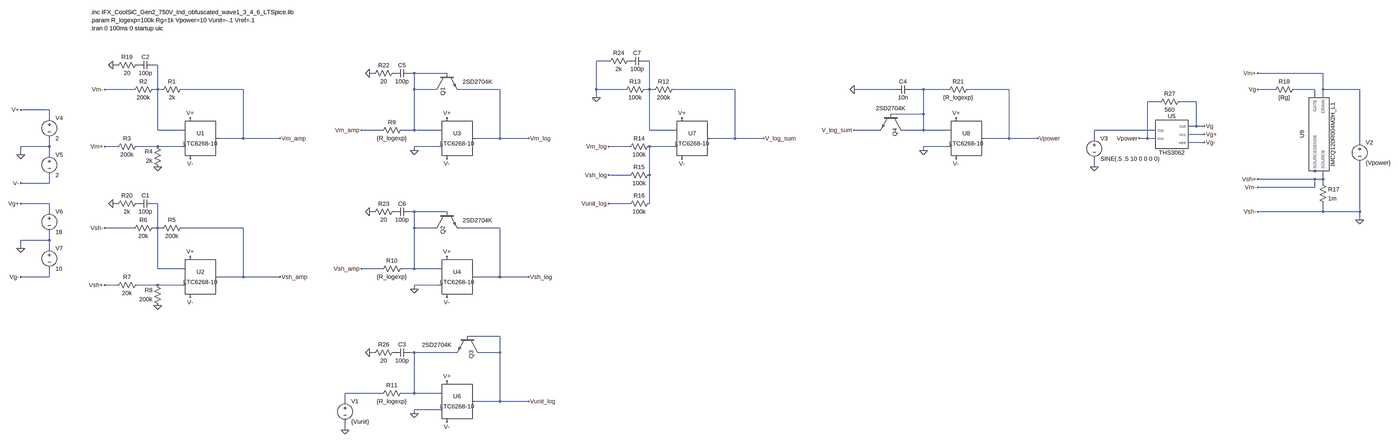
[diagram p0: schematic Power Tester.asc, whole sheet]
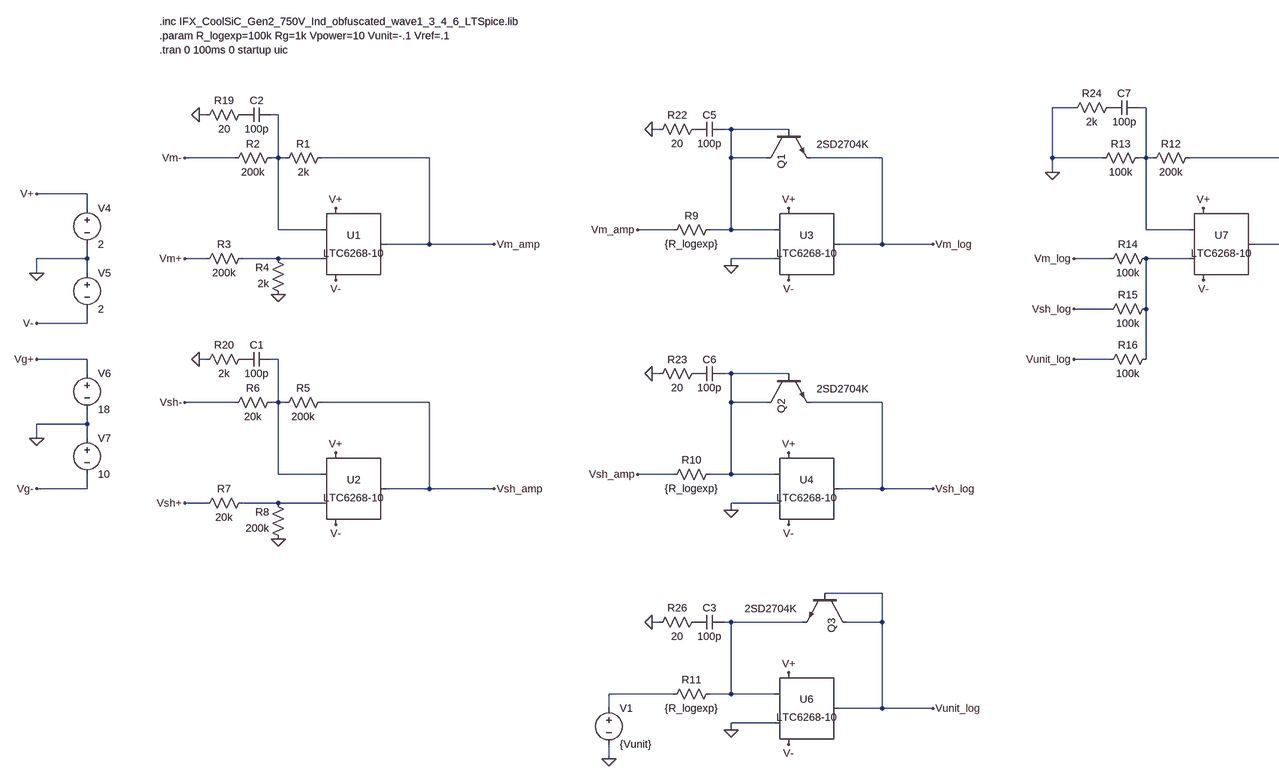
[diagram p1: schematic Power Tester.asc, part, row 1 of 1, column 1 of 2]
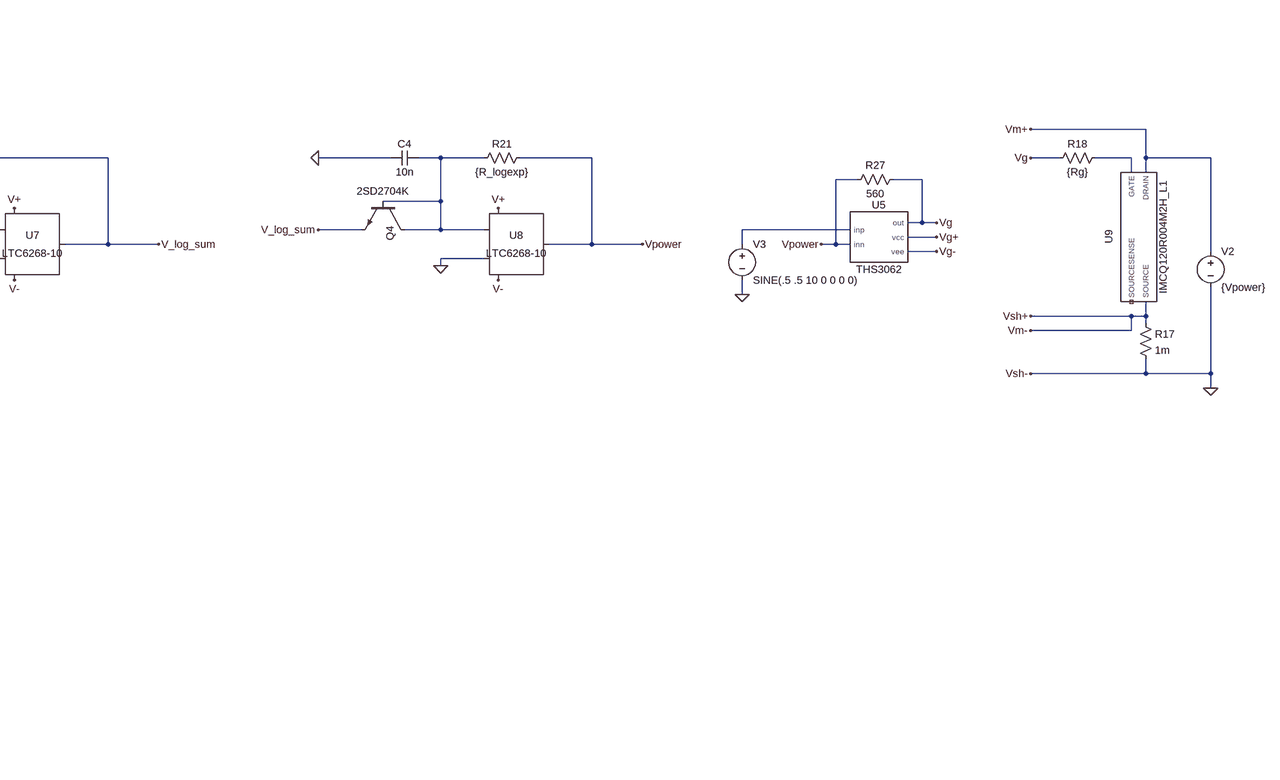
[diagram p2: schematic Power Tester.asc, part, row 1 of 1, column 2 of 2]
Power Tester.asc, the LTspice schematic file:
Version 4.1
SHEET 1 6168 1376
WIRE 2432 -192 2384 -192
WIRE 2592 -192 2576 -192
WIRE -192 -176 -208 -176
WIRE -32 -176 -48 -176
WIRE 1120 -144 1104 -144
WIRE 1280 -144 1264 -144
WIRE 1408 -144 1280 -144
WIRE 5808 -144 5552 -144
WIRE -128 -80 -240 -80
WIRE -32 -80 -32 -176
WIRE -32 -80 -48 -80
WIRE -16 -80 -32 -80
WIRE 304 -80 64 -80
WIRE 1280 -80 1280 -144
WIRE 1360 -80 1280 -80
WIRE 1616 -80 1456 -80
WIRE 2384 -80 2384 -192
WIRE 2496 -80 2384 -80
WIRE 2592 -80 2592 -192
WIRE 2592 -80 2576 -80
WIRE 2608 -80 2592 -80
WIRE 2928 -80 2688 -80
WIRE 3792 -80 3632 -80
WIRE 3904 -80 3856 -80
WIRE 4000 -80 3904 -80
WIRE 4240 -80 4080 -80
WIRE 5616 -80 5552 -80
WIRE 5776 -80 5696 -80
WIRE 5808 -80 5808 -144
WIRE 5952 -80 5808 -80
WIRE 2384 -48 2384 -80
WIRE 5776 -48 5776 -80
WIRE 5808 -48 5808 -80
WIRE 4960 -32 4912 -32
WIRE 5104 -32 5040 -32
WIRE -912 0 -1024 0
WIRE 3904 16 3904 -80
WIRE 3904 16 3776 16
WIRE -912 32 -912 0
WIRE 5104 64 5104 -32
WIRE 5104 64 5072 64
WIRE 5136 64 5104 64
WIRE -32 80 -32 -80
WIRE 64 80 -32 80
WIRE 1152 80 1072 80
WIRE 1280 80 1280 -80
WIRE 1280 80 1232 80
WIRE 1376 80 1280 80
WIRE 2592 80 2592 -80
WIRE 2688 80 2592 80
WIRE 3728 80 3632 80
WIRE 3904 80 3904 16
WIRE 3904 80 3824 80
WIRE 4000 80 3904 80
WIRE 4944 80 4704 80
WIRE 5136 96 5072 96
WIRE 304 112 304 -80
WIRE 304 112 208 112
WIRE 448 112 304 112
WIRE 1616 112 1616 -80
WIRE 1616 112 1520 112
WIRE 1760 112 1616 112
WIRE 2928 112 2928 -80
WIRE 2928 112 2832 112
WIRE 3072 112 2928 112
WIRE 4240 112 4240 -80
WIRE 4240 112 4144 112
WIRE 4384 112 4240 112
WIRE 4704 112 4704 80
WIRE 4912 112 4912 -32
WIRE 4912 112 4880 112
WIRE 4944 112 4912 112
WIRE 5136 128 5072 128
WIRE 5952 128 5952 -80
WIRE -912 144 -912 112
WIRE -912 144 -1024 144
WIRE -192 144 -240 144
WIRE -32 144 -112 144
WIRE 64 144 -32 144
WIRE 1376 144 1280 144
WIRE 2512 144 2432 144
WIRE 2688 144 2592 144
WIRE 4000 144 3904 144
WIRE 1280 160 1280 144
WIRE 3904 160 3904 144
WIRE -1024 176 -1024 144
WIRE -912 176 -912 144
WIRE 4704 224 4704 192
WIRE 2512 256 2432 256
WIRE 2592 256 2592 144
WIRE 5776 272 5552 272
WIRE 5808 272 5808 240
WIRE 5808 272 5776 272
WIRE -912 288 -912 256
WIRE -912 288 -1024 288
WIRE 5808 288 5808 272
WIRE 5776 304 5776 272
WIRE 5776 304 5552 304
WIRE -912 368 -1024 368
WIRE -192 368 -208 368
WIRE -32 368 -48 368
WIRE 2512 368 2432 368
WIRE 2592 368 2592 256
WIRE -912 400 -912 368
WIRE 1120 400 1104 400
WIRE 1280 400 1264 400
WIRE 1408 400 1280 400
WIRE 5808 400 5808 368
WIRE 5808 400 5552 400
WIRE 5952 400 5952 208
WIRE 5952 400 5808 400
WIRE 5952 432 5952 400
WIRE -128 464 -240 464
WIRE -32 464 -32 368
WIRE -32 464 -48 464
WIRE -16 464 -32 464
WIRE 304 464 64 464
WIRE 1280 464 1280 400
WIRE 1360 464 1280 464
WIRE 1616 464 1456 464
WIRE -912 512 -912 480
WIRE -912 512 -1024 512
WIRE -1024 544 -1024 512
WIRE -912 544 -912 512
WIRE -32 624 -32 464
WIRE 64 624 -32 624
WIRE 1152 624 1072 624
WIRE 1280 624 1280 464
WIRE 1280 624 1232 624
WIRE 1376 624 1280 624
WIRE -912 656 -912 624
WIRE -912 656 -1024 656
WIRE 304 656 304 464
WIRE 304 656 208 656
WIRE 448 656 304 656
WIRE 1616 656 1616 464
WIRE 1616 656 1520 656
WIRE 1760 656 1616 656
WIRE -192 688 -240 688
WIRE -32 688 -112 688
WIRE 64 688 -32 688
WIRE 1376 688 1280 688
WIRE 1280 704 1280 688
WIRE 1616 944 1488 944
WIRE 1120 1008 1104 1008
WIRE 1280 1008 1264 1008
WIRE 1440 1008 1280 1008
WIRE 1616 1008 1616 944
WIRE 1616 1008 1536 1008
WIRE 1152 1168 1008 1168
WIRE 1280 1168 1280 1008
WIRE 1280 1168 1232 1168
WIRE 1376 1168 1280 1168
WIRE 1008 1200 1008 1168
WIRE 1616 1200 1616 1008
WIRE 1616 1200 1520 1200
WIRE 1760 1200 1616 1200
WIRE 1376 1232 1280 1232
WIRE 1280 1248 1280 1232
WIRE 1008 1312 1008 1280
FLAG -32 224 0
FLAG 96 192 V-
FLAG 96 32 V+
FLAG -240 -80 Vm-
FLAG -240 144 Vm+
FLAG -32 768 0
FLAG 96 736 V-
FLAG 96 576 V+
FLAG -240 464 Vsh-
FLAG -240 688 Vsh+
FLAG 1408 192 V-
FLAG 1408 32 V+
FLAG 448 112 Vm_amp
FLAG 448 656 Vsh_amp
FLAG 1280 160 0
FLAG 1072 80 Vm_amp
FLAG 1760 112 Vm_log
FLAG 1408 736 V-
FLAG 1408 576 V+
FLAG 1280 704 0
FLAG 1072 624 Vsh_amp
FLAG 1760 656 Vsh_log
FLAG 1408 1280 V-
FLAG 1408 1120 V+
FLAG 1280 1248 0
FLAG 1760 1200 Vunit_log
FLAG 1008 1312 0
FLAG 2720 192 V-
FLAG 3072 112 V_log_sum
FLAG 2720 32 V+
FLAG 2384 -48 0
FLAG 2432 256 Vsh_log
FLAG 2432 144 Vm_log
FLAG 2432 368 Vunit_log
FLAG 4032 192 V-
FLAG 4032 32 V+
FLAG 3904 160 0
FLAG 3632 80 V_log_sum
FLAG 4384 112 Vpower
FLAG 5136 96 Vg+
FLAG 5136 128 Vg-
FLAG 5136 64 Vg
FLAG 4880 112 Vpower
FLAG 5552 -80 Vg
FLAG 5552 272 Vsh+
FLAG 5552 304 Vm-
FLAG 5552 400 Vsh-
FLAG 5552 -144 Vm+
FLAG 4704 224 0
FLAG 5952 432 0
FLAG -1024 176 0
FLAG -1024 0 V+
FLAG -1024 288 V-
FLAG -1024 544 0
FLAG -1024 368 Vg+
FLAG -1024 656 Vg-
FLAG -208 -176 0
FLAG -208 368 0
FLAG 1104 -144 0
FLAG 1104 400 0
FLAG 3632 -80 0
FLAG 1104 1008 0
SYMBOL OpAmps\\LTC6268-10 96 112 R0
SYMATTR InstName U1
SYMBOL res 80 -96 R90
WINDOW 0 0 56 VBottom 2
WINDOW 3 32 56 VTop 2
SYMATTR InstName R1
SYMATTR Value 2k
SYMBOL res -32 -96 R90
WINDOW 0 0 56 VBottom 2
WINDOW 3 32 56 VTop 2
SYMATTR InstName R2
SYMATTR Value 200k
SYMBOL res -96 128 R90
WINDOW 0 0 56 VBottom 2
WINDOW 3 32 56 VTop 2
SYMATTR InstName R3
SYMATTR Value 200k
SYMBOL res -16 240 R180
WINDOW 0 36 76 Left 2
WINDOW 3 36 40 Left 2
SYMATTR InstName R4
SYMATTR Value 2k
SYMBOL OpAmps\\LTC6268-10 96 656 R0
SYMATTR InstName U2
SYMBOL res 80 448 R90
WINDOW 0 0 56 VBottom 2
WINDOW 3 32 56 VTop 2
SYMATTR InstName R5
SYMATTR Value 200k
SYMBOL res -32 448 R90
WINDOW 0 0 56 VBottom 2
WINDOW 3 32 56 VTop 2
SYMATTR InstName R6
SYMATTR Value 20k
SYMBOL res -96 672 R90
WINDOW 0 0 56 VBottom 2
WINDOW 3 32 56 VTop 2
SYMATTR InstName R7
SYMATTR Value 20k
SYMBOL res -16 784 R180
WINDOW 0 36 76 Left 2
WINDOW 3 36 40 Left 2
SYMATTR InstName R8
SYMATTR Value 200k
SYMBOL OpAmps\\LTC6268-10 1408 112 R0
SYMATTR InstName U3
SYMBOL OpAmps\\LTC6268-10 1408 656 R0
SYMATTR InstName U4
SYMBOL OpAmps\\LTC6268-10 1408 1200 R0
SYMATTR InstName U6
SYMBOL res 1248 64 R90
WINDOW 0 0 56 VBottom 2
WINDOW 3 32 56 VTop 2
SYMATTR InstName R9
SYMATTR Value {R_logexp}
SYMBOL npn 1360 -144 M90
WINDOW 3 34 226 VLeft 2
SYMATTR Value 2SD2704K
SYMATTR InstName Q1
SYMBOL res 1248 608 R90
WINDOW 0 0 56 VBottom 2
WINDOW 3 32 56 VTop 2
SYMATTR InstName R10
SYMATTR Value {R_logexp}
SYMBOL npn 1360 400 M90
WINDOW 3 34 226 VLeft 2
SYMATTR Value 2SD2704K
SYMATTR InstName Q2
SYMBOL res 1248 1152 R90
WINDOW 0 0 56 VBottom 2
WINDOW 3 32 56 VTop 2
SYMATTR InstName R11
SYMATTR Value {R_logexp}
SYMBOL npn 1536 944 R90
WINDOW 3 34 226 VLeft 2
SYMATTR Value 2SD2704K
SYMATTR InstName Q3
SYMBOL voltage 1008 1184 R0
WINDOW 123 0 0 Left 0
WINDOW 39 0 0 Left 0
SYMATTR InstName V1
SYMATTR Value {Vunit}
SYMBOL OpAmps\\LTC6268-10 2720 112 R0
SYMATTR InstName U7
SYMBOL res 2704 -96 R90
WINDOW 0 0 56 VBottom 2
WINDOW 3 32 56 VTop 2
SYMATTR InstName R12
SYMATTR Value 200k
SYMBOL res 2592 -96 R90
WINDOW 0 0 56 VBottom 2
WINDOW 3 32 56 VTop 2
SYMATTR InstName R13
SYMATTR Value 100k
SYMBOL res 2608 240 R90
WINDOW 0 0 56 VBottom 2
WINDOW 3 32 56 VTop 2
SYMATTR InstName R15
SYMATTR Value 100k
SYMBOL res 2608 128 R90
WINDOW 0 0 56 VBottom 2
WINDOW 3 32 56 VTop 2
SYMATTR InstName R14
SYMATTR Value 100k
SYMBOL res 2608 352 R90
WINDOW 0 0 56 VBottom 2
WINDOW 3 32 56 VTop 2
SYMATTR InstName R16
SYMATTR Value 100k
SYMBOL OpAmps\\LTC6268-10 4032 112 R0
SYMATTR InstName U8
SYMBOL res 4096 -96 R90
WINDOW 0 0 56 VBottom 2
WINDOW 3 32 56 VTop 2
SYMATTR InstName R21
SYMATTR Value {R_logexp}
SYMBOL npn 3824 16 R90
WINDOW 3 -22 107 VLeft 2
SYMATTR Value 2SD2704K
SYMATTR InstName Q4
SYMBOL THS3062 5008 96 R0
SYMATTR InstName U5
SYMBOL IMCQ120R004M2H_L1 5792 96 R90
WINDOW 0 0 50 Top 2
WINDOW 3 0 -71 Top 2
SYMATTR InstName U9
SYMBOL voltage 5952 112 R0
WINDOW 123 0 0 Left 0
WINDOW 39 0 0 Left 0
SYMATTR InstName V2
SYMATTR Value {Vpower}
SYMBOL res 5792 272 R0
SYMATTR InstName R17
SYMATTR Value 1m
SYMBOL res 5712 -96 R90
WINDOW 0 0 56 VBottom 2
WINDOW 3 32 56 VTop 2
SYMATTR InstName R18
SYMATTR Value {Rg}
SYMBOL voltage 4704 96 R0
WINDOW 123 0 0 Left 0
WINDOW 39 0 0 Left 0
SYMATTR InstName V3
SYMATTR Value SINE(.5 .5 10 0 0 0 0)
SYMBOL voltage -912 16 R0
WINDOW 123 0 0 Left 0
WINDOW 39 0 0 Left 0
SYMATTR InstName V4
SYMATTR Value 2
SYMBOL voltage -912 160 R0
WINDOW 123 0 0 Left 0
WINDOW 39 0 0 Left 0
SYMATTR InstName V5
SYMATTR Value 2
SYMBOL voltage -912 384 R0
WINDOW 123 0 0 Left 0
WINDOW 39 0 0 Left 0
SYMATTR InstName V6
SYMATTR Value 18
SYMBOL voltage -912 528 R0
WINDOW 123 0 0 Left 0
WINDOW 39 0 0 Left 0
SYMATTR InstName V7
SYMATTR Value 10
SYMBOL cap -112 -160 R270
WINDOW 0 32 32 VTop 2
WINDOW 3 0 32 VBottom 2
SYMATTR InstName C2
SYMATTR Value 100p
SYMBOL res -96 -192 R90
WINDOW 0 0 56 VBottom 2
WINDOW 3 32 56 VTop 2
SYMATTR InstName R19
SYMATTR Value 20
SYMBOL cap -112 384 R270
WINDOW 0 32 32 VTop 2
WINDOW 3 0 32 VBottom 2
SYMATTR InstName C1
SYMATTR Value 100p
SYMBOL res -96 352 R90
WINDOW 0 0 56 VBottom 2
WINDOW 3 32 56 VTop 2
SYMATTR InstName R20
SYMATTR Value 2k
SYMBOL cap 1200 -128 R270
WINDOW 0 32 32 VTop 2
WINDOW 3 0 32 VBottom 2
SYMATTR InstName C5
SYMATTR Value 100p
SYMBOL res 1216 -160 R90
WINDOW 0 0 56 VBottom 2
WINDOW 3 32 56 VTop 2
SYMATTR InstName R22
SYMATTR Value 20
SYMBOL cap 1200 416 R270
WINDOW 0 32 32 VTop 2
WINDOW 3 0 32 VBottom 2
SYMATTR InstName C6
SYMATTR Value 100p
SYMBOL res 1216 384 R90
WINDOW 0 0 56 VBottom 2
WINDOW 3 32 56 VTop 2
SYMATTR InstName R23
SYMATTR Value 20
SYMBOL cap 2512 -176 R270
WINDOW 0 32 32 VTop 2
WINDOW 3 0 32 VBottom 2
SYMATTR InstName C7
SYMATTR Value 100p
SYMBOL res 2528 -208 R90
WINDOW 0 0 56 VBottom 2
WINDOW 3 32 56 VTop 2
SYMATTR InstName R24
SYMATTR Value 2k
SYMBOL cap 1200 1024 R270
WINDOW 0 32 32 VTop 2
WINDOW 3 0 32 VBottom 2
SYMATTR InstName C3
SYMATTR Value 100p
SYMBOL res 1216 992 R90
WINDOW 0 0 56 VBottom 2
WINDOW 3 32 56 VTop 2
SYMATTR InstName R26
SYMATTR Value 20
SYMBOL res 5056 -48 R90
WINDOW 0 0 56 VBottom 2
WINDOW 3 32 56 VTop 2
SYMATTR InstName R27
SYMATTR Value 560
SYMBOL cap 3856 -96 R90
WINDOW 0 0 32 VBottom 2
WINDOW 3 32 32 VTop 2
SYMATTR InstName C4
SYMATTR Value 10n
TEXT -296 -384 Left 2 !.inc IFX_CoolSiC_Gen2_750V_Ind_obfuscated_wave1_3_4_6_LTSpice.lib
TEXT -296 -320 Left 2 !.tran 0 100ms 0 startup uic
TEXT -296 -352 Left 2 !.param R_logexp=100k Rg=1k Vpower=10 Vunit=-.1 Vref=.1

The netlist it stands for:
* Power Tester.asc
X§U1 N007 N002 Vm_amp V+ V- NC_01 LTC6268-10
R1 Vm_amp N002 2k
R2 N002 Vsh+ 200k
R3 N007 Vm+ 200k
R4 0 N007 2k
X§U2 N011 N009 Vsh_amp V+ V- NC_02 LTC6268-10
R5 Vsh_amp N009 200k
R6 N009 0 20k
R7 N011 Vsh+ 20k
R8 0 N011 200k
X§U3 0 N003 Vm_log V+ V- NC_03 LTC6268-10
X§U4 0 N010 Vsh_log V+ V- NC_04 LTC6268-10
X§U6 0 N012 Vunit_log V+ V- NC_05 LTC6268-10
R9 N003 Vm_amp {R_logexp}
Q1 N003 N003 Vm_log 0 2SD2704K
R10 N010 Vsh_amp {R_logexp}
Q2 N010 N010 Vsh_log 0 2SD2704K
R11 N012 N013 {R_logexp}
Q3 Vunit_log Vunit_log N012 0 2SD2704K
V1 N013 0 {Vunit}
X§U7 N008 N001 V_log_sum V+ V- NC_06 LTC6268-10
R12 V_log_sum N001 200k
R13 N001 0 100k
R15 N008 Vsh_log 100k
R14 N008 Vm_log 100k
R16 N008 Vunit_log 100k
X§U8 0 N004 Vpower V+ V- NC_07 LTC6268-10
R21 Vpower N004 {R_logexp}
Q4 N004 N004 V_log_sum 0 2SD2704K
X§U5 N006 Vpower Vg Vg+ Vg- THS3062  ; pins inp inn out vcc vee
X§U9 Vm+ N005 Vsh+ NC_08 IMCQ120R004M2H_L1  ; pins DRAIN GATE SOURCE SOURCESENSE
V2 Vm+ 0 {Vpower}
R17 Vsh+ 0 1m
R18 N005 Vg {Rg}
V3 N006 0 SINE(.5 .5 10 0 0 0 0)
V4 V+ 0 2
V5 0 V- 2
V6 Vg+ 0 18
V7 0 Vg- 10
C2 P001 N002 100p
R19 P001 0 20
C1 P002 N009 100p
R20 P002 0 2k
C5 P003 N003 100p
R22 P003 0 20
C6 P004 N010 100p
R23 P004 0 20
C7 P005 N001 100p
R24 P005 0 2k
C3 P006 N012 100p
R26 P006 0 20
R27 Vg Vpower 560
C4 N004 0 10n
.model NPN NPN
.model PNP PNP
.lib standard.bjt
.inc IFX_CoolSiC_Gen2_750V_Ind_obfuscated_wave1_3_4_6_LTSpice.lib
.tran 0 100ms 0 startup uic
.param R_logexp=100k Rg=1k Vpower=10 Vunit=-.1 Vref=.1
.lib LTC2.lib
.lib THS3062.txt
.lib CoolSiC_1200V_Gen2_Trench_MOSFET_L1_L3.lib
.backanno
.end